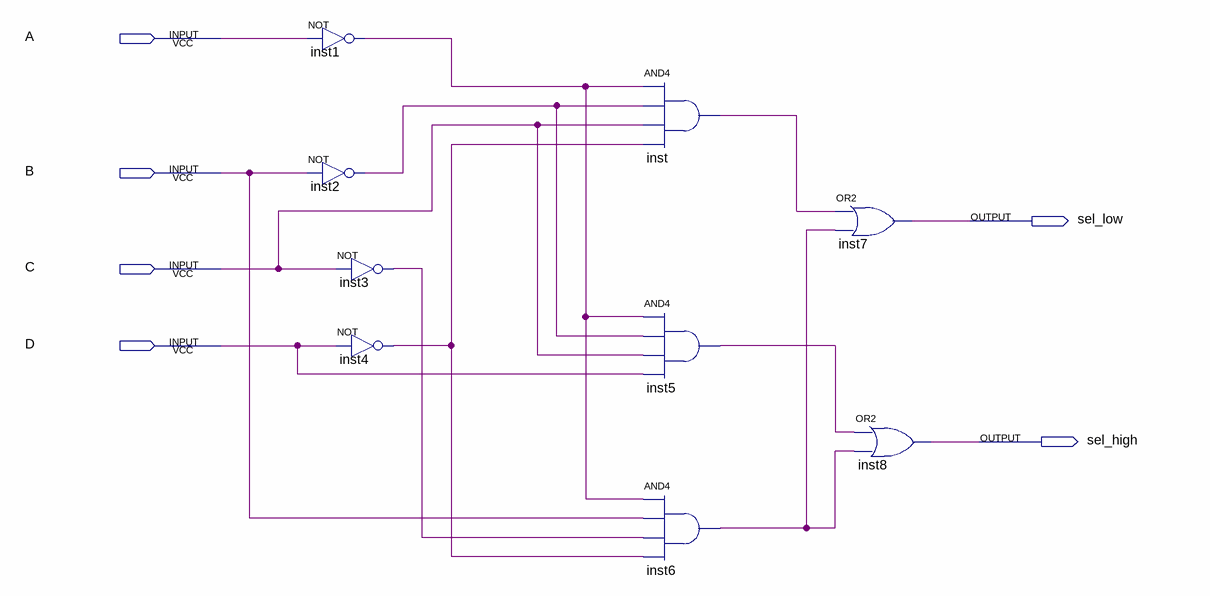
[diagram p0: schematic sheet]
// Quartus schematic UC_ULA.bdf as structural Verilog: 9 symbols, 6 pins
module UC_ULA (
  input  A,
  input  B,
  input  C,
  input  D,
  output sel_low,
  output sel_high
);

  wire inst1_out, inst2_out, inst3_out, inst4_out, inst5_out, inst6_out, inst_out;

  not inst1 (inst1_out, A);
  not inst2 (inst2_out, B);
  not inst3 (inst3_out, C);
  not inst4 (inst4_out, D);
  and inst (inst_out, inst1_out, inst2_out, C, inst4_out);
  and inst5 (inst5_out, inst1_out, inst2_out, C, D);
  and inst6 (inst6_out, inst1_out, B, inst3_out, inst4_out);
  or inst7 (sel_low, inst_out, inst6_out);
  or inst8 (sel_high, inst5_out, inst6_out);
endmodule
